# Altium project EMGintegrated.PrjPcb
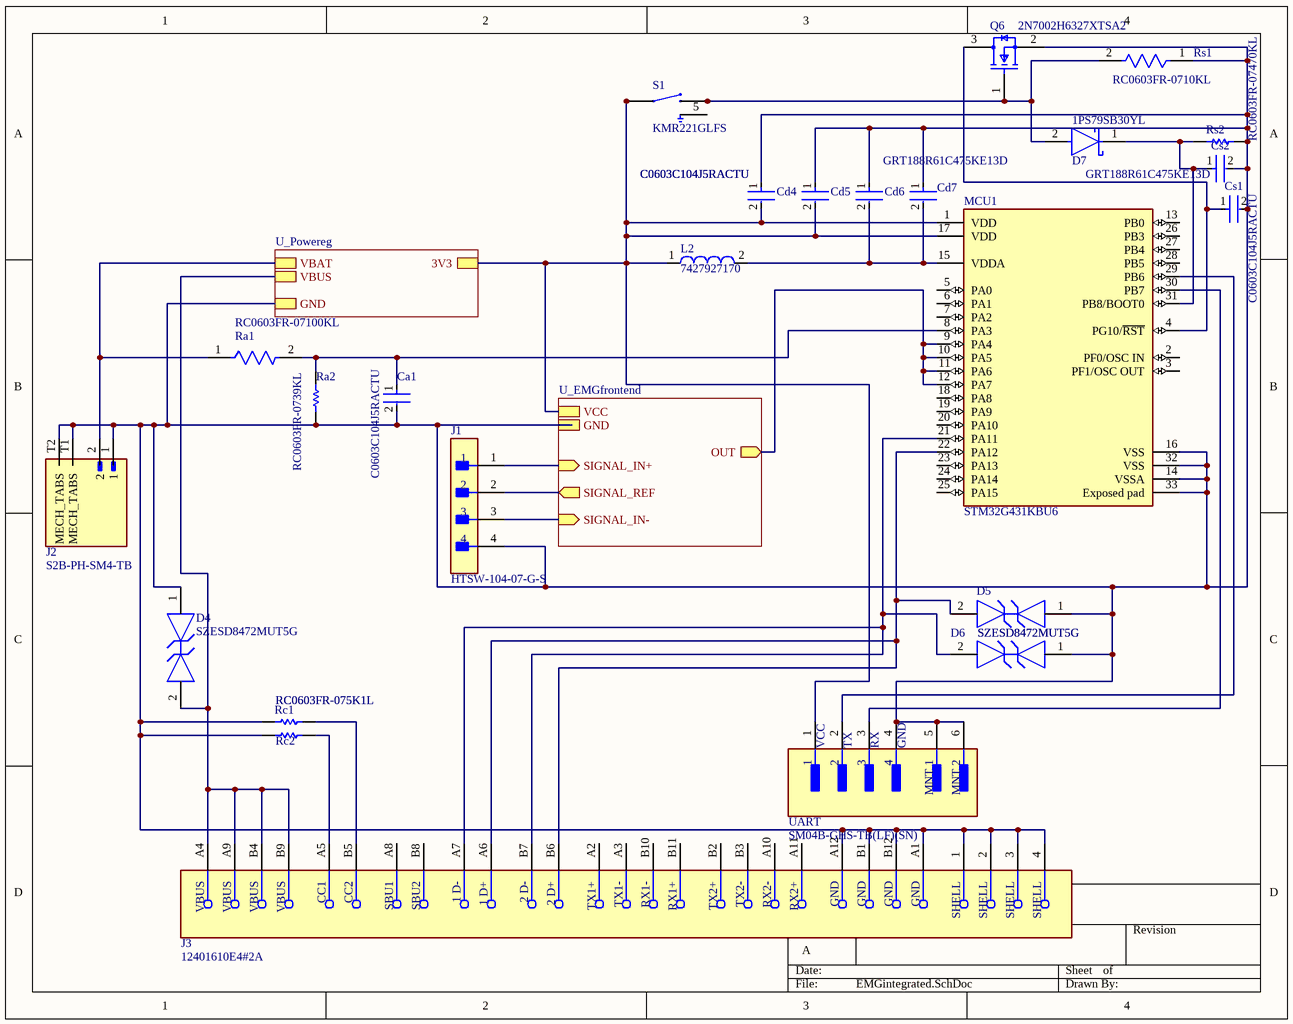
[diagram p0: EMGintegrated.SchDoc]
8 sheets, 62 parts. Net scope: hierarchical (ports join the sheet entries above them; power ports are global).
Board file: EMGintegrated.PcbDoc
Sheets:
  EMGintegrated.SchDoc
    U_EMGfrontend = EMGfrontend.SchDoc
      VREF = VREF.SchDoc
      AMP2 = AMP2.SchDoc
      LPF(500Hz) = LPF(500Hz).SchDoc
      AMP1 = AMP1.SchDoc
      HPF(20Hz) = HPF(20Hz).SchDoc
    U_Powereg = Powereg.SchDoc

## Sheet EMGintegrated.SchDoc
size A; SheetNumber: 1; SheetTotal: 8

### Parts
Ca1  C0603C104J5RACTU  [FP-C0603C-CF-MFG]
Cd4  C0603C104J5RACTU  [FP-C0603C-CF-MFG]
Cd5  C0603C104J5RACTU  [FP-C0603C-CF-MFG]
Cd6  C0603C104J5RACTU  [FP-C0603C-CF-MFG]
Cd7  GRT188R61C475KE13D  [FP-GRT188-0_15-IPC_C]
Cs1  C0603C104J5RACTU  [FP-C0603C-CF-MFG]
Cs2  GRT188R61C475KE13D  [FP-GRT188-0_15-IPC_C]
D4  SZESD8472MUT5G  [FP-152AF-MFG]
D5  SZESD8472MUT5G  [FP-152AF-MFG]
D6  SZESD8472MUT5G  [FP-152AF-MFG]
D7  1PS79SB30YL  [FP-SOD523-MFG]
J1  HTSW-104-07-G-S  [FP-HTSW-104-07-G-S-MFG]
J2  S2B-PH-SM4-TB  [JST_S2B-PH-SM4-TB]
J3  12401610E4#2A  [FP-12401610E4#2A-MFG]
L2  7427927170  [SMD-0402]
MCU1  STM32G431KBU6  [FP-UFQFPN32-A0B8-IPC_A]
Q6  2N7002H6327XTSA2  [FP-PG-SOT23-3-MFG]
Ra1  RC0603FR-07100KL  [FP-RC0603-0_55-MFG]
Ra2  RC0603FR-0739KL  [RESC1608X55X25LL10T15]
Rc1  RC0603FR-075K1L  [RESC1608X55X25ML10T15]
Rc2  RC0603FR-075K1L  [RESC1608X55X25ML10T15]
Rs1  RC0603FR-0710KL  [FP-RC0603-0_55-IPC_C]
Rs2  RC0603FR-07470KL  [RESC1608X55X25ML10T15]
S1  KMR221GLFS  [SW_KMR221GLFS]
UART  SM04B-GHS-TB(LF)(SN)  [FP-SM04B-GHS-TB_LF_SN-MFG]

### Sub-sheets
U_EMGfrontend = EMGfrontend.SchDoc: OUT (out), VCC, GND, SIGNAL_IN+ (in), SIGNAL_REF (out), SIGNAL_IN- (in)
U_Powereg = Powereg.SchDoc: VBAT, 3V3, GND, VBUS

### Nets
NetC0_1: MCU1.9(PA4) MCU1.10(PA5) MCU1.11(PA6) MCU1.12(PA7) ; sheet U_EMGfrontend/OUT
NetC0_2: Ca1.2 Cd4.1 Cd5.1 Cd6.1 Cd7.1 Cs1.2 Cs2.2 D4.1 D5.1 D6.1 J1.4 J2.1 J2.T1(MECH_TABS) J2.T2(MECH_TABS) J3.1(SHELL) J3.2(SHELL) J3.3(SHELL) J3.4(SHELL) J3.A1(GND) J3.A12(GND) J3.B1(GND) J3.B12(GND) MCU1.14(VSSA) MCU1.16(VSS) MCU1.32(VSS) MCU1.33(Exposed_pad) Q6.2(source) Ra2.1 Rc1.1 Rc2.1 Rs1.1 Rs2.2 UART.4 UART.5(MNT_1) UART.6(MNT_2) ; sheet U_EMGfrontend/GND, sheet U_Powereg/GND
NetC1_1: J1.2 ; sheet U_EMGfrontend/SIGNAL_REF
NetCa1_1: Ca1.1 MCU1.8(PA3) Ra1.2 Ra2.2
NetCd4_2: Cd4.2 Cd5.2 L2.1 MCU1.1(VDD) MCU1.17(VDD) S1.1 S1.4 UART.1 ; sheet U_EMGfrontend/VCC, sheet U_Powereg/3V3
NetCd6_2: Cd6.2 Cd7.2 L2.2 MCU1.15(VDDA)
NetCs1_1: Cs1.1 MCU1.4(PG10/~{RST}) Q6.3(drain)
NetCs2_1: Cs2.1 D7.1(C) MCU1.31(PB8/BOOT0) Rs2.1
NetD2_2: J2.2 Ra1.1 ; sheet U_Powereg/VBAT
NetD3_2: D4.2 J3.A4(VBUS) J3.A9(VBUS) J3.B4(VBUS) J3.B9(VBUS) ; sheet U_Powereg/VBUS
NetD5_2: D5.2 J3.A6(1_D+) J3.B6(2_D+) MCU1.22(PA12)
NetD6_2: D6.2 J3.A7(1_D-) J3.B7(2_D-) MCU1.21(PA11)
NetD7_2: D7.2(A) Q6.1(gate) Rs1.2 S1.2 S1.3
NetJ1_1: J1.1 ; sheet U_EMGfrontend/SIGNAL_IN+
NetJ1_3: J1.3 ; sheet U_EMGfrontend/SIGNAL_IN-
NetJ3_A5: J3.A5(CC1) Rc2.2
NetJ3_B5: J3.B5(CC2) Rc1.2
NetMCU1_29: MCU1.29(PB6) UART.2
NetMCU1_30: MCU1.30(PB7) UART.3

Not connected (* = marked no-connect by the designer): J3 A2(TX1+) A3(TX1-) A8(SBU1) A10(RX2-) A11(RX2+) B2(TX2+) B3(TX2-) B8(SBU2) B10(RX1-) B11(RX1+); MCU1 2(PF0/OSC_IN) 3(PF1/OSC_OUT) 5(PA0) 6(PA1) 7(PA2) 13(PB0) 18(PA8) 19(PA9) 20(PA10) 23(PA13) 24(PA14) 25(PA15) 26(PB3) 27(PB4) 28(PB5); S1 5

### Notes on the sheet
- (near UART) VCC
- (near UART) TX
- (near UART) RX
- (near UART) GND

### Library data of the parts
Ca1 Cd4-Cd6 Cs1 = CMP-2006-03056-2: CAP CER 0.1UF 50V 5% X7R 0603; Manufacturer: KEMET; Automotive Grade: Grade 1; Tolerance: 0.05; Capacitance: 0.10 μF; Value: 0.10 μF; Temperature Coefficient: 30ppm/°C; ComponentLink2Description: Datasheet; Voltage Rating: 50 V; Digikey Description: CAP CER 0.1UF 50V 5% X7R 0603; Manufacturer Part Number: C0603C104J5RACTU; Temperature Range High: +125°C; Device Class L2: Capacitors; Octopart: https://octopart.com/c0603c104j5ractu-kemet-10440638; RoHS: TRUE; Mouser Description: Multilayer Ceramic Capacitors MLCC - SMD/SMT 50volts 0.1uF X7R 5%; Temperature Range Low: -55°C; Automotive: Yes; Lead Free: Yes; ComponentLink2URL: https://api.kemet.com/component-edge/download/datasheet/C0603C100J5GACAUTO.pdf; Material: Ceramic; Device Class L3: Ceramic Capacitors; Package: C0603C-CF; Category: Cap; Temperature: -55°C to +125°C; Height: 0.87mm; Temperature Characteristic: X7R; Device Class L1: Passive Components
Cd7 Cs2 = CMP-06035-009119-1: Multi-Layer Ceramic Capacitor 4.7uF 16V X5R ±10% 0603 Paper T/R; Mount: Surface Mount; Width: 0.031inch; Case Code (Imperial): 0603; Capacitance: 4.7uF; Thickness: 0.035inch; Packaging: Cut Tape; Min Operating Temperature: -55°C; Case Code (Metric): 1608; Case/Package: 0603; Tolerance: 10%; Length: 0.063inch; Ratings: AEC-Q200; Max Operating Temperature: 85°C; Voltage Rating: 16V
D4-D6 = CMP-07200-000010-1: TVS DIODE 5.3V 14V 2X3DFN; Number of Bidirectional Channels: 1; Element Configuration: Single; Capacitance: 0.3pF; Peak Pulse Current: 3A; Power Line Protection: No; Min Breakdown Voltage: 7V; Direction: Bidirectional; Case/Package: DFN; Lead Free: Lead Free; Reverse Standoff Voltage: 5.3V; Clamping Voltage: 14V; Resistor Type: Zener; Packaging: Tape and Reel; Mount: Surface Mount; Number of Pins: 2; Max Operating Temperature: 150°C; Min Operating Temperature: -55°C; Working Voltage: 5.3V; RoHS Compliant: Yes
D7 = CMP-14398-000044-1: Schottky Diode, Single, 150Deg C, Sod523 Rohs Compliant: Yes
J1 = CMP-02766-001776-1: CONN HEADER VERT 4POS 2.54MM; Gender: Male; Number of Contacts: 4; Packaging: Bulk; RoHS Compliant: Yes; Number of Rows: 1; Mount: Through Hole; Contact Material: Bronze; Series: HTSW; Radiation Hardening: No; Pitch: 2.54mm; Reach SVHC Compliant: Yes; Contact Plating: Gold; Termination: Through Hole
J2 = S2B-PH-SM4-TB: MANUFACTURER: JST Sales; UNIT: MM; MAXIMUM_PACKAGE_HEIGHT: 5.5mm; MPN: S2B-PH-SM4-TB; STANDARD: Manufacturer Recommendations; Value: *
J3 = CMP-02355-000003-1: CONN RCP USB3.1 TYPEC 24P SMD RA; Connector Type: USB; Number of Contacts: 24; Gender: Receptacle; Packaging: Cut Tape; Mount: Surface Mount; Number of Pins: 24
L2 = CMP-0220-00142-1: SMD EMI Suppression Ferrite Bead WE-CBF, Z = 75 Ohm; Impedance: 75 Ohm; ComponentLink2Description: Datasheet; ComponentLink2URL: http://www.we-online.de/katalog/media/pdf/7427927170.pdf; ComponentLink1URL: http://www.we-online.com; PackageVersion: 2009; ComponentLink1Description: Manufacturer Link; PackageReference: SMD-0402; PackageDescription: Chip Inductor, 2-Leads, Body 1.0 x 0.5 mm; DatasheetVersion: ver 1, Jul-2009
MCU1 = CMP-12105-000119-1: IC MCU 32BIT 128KB FLSH 32UFQFPN; RoHS Compliant: Yes
Q6 = CMP-32901-000180-1: MOSFET N-CH 60V 0.3A SOT23; Rise Time: 3.3ns; Input Capacitance: 20pF; Rds On Max: 3R; Gate to Source Voltage (Vgs): 20V; Continuous Drain Current (ID): 300mA; Max Power Dissipation: 500mW; Packaging: Tape and Reel; Mount: Surface Mount; Case/Package: SOT-23; Drain to Source Voltage (Vdss): 60V; Min Operating Temperature: -55°C; Halogen Free: Halogen Free; Max Dual Supply Voltage: 60V; Number of Pins: 3; Lead Free: Lead Free; Max Operating Temperature: 150°C
Ra1 = CMP-2100-03662-2: RES SMD 100K OHM 1% 1/10W 0603; Voltage Rating (DC): 50V; Resistance: 100kR; Max Power Dissipation: 100mW; Temperature Coefficient: 100ppm/°C; Working Voltage: 75V; Length: 1.6mm; Lead Free: Lead Free; Number of Terminations: 2; Packaging: Tape and Reel; Voltage Rating: 50V; Termination: SMD/SMT; Width: 0.8mm; Resistor Type: Thick Film; Resistance Tolerance: 1%; Features: Moisture Resistant; Height: 0.45mm; Construction: Rectangular; Case/Package: 0603; Military Standard: Not; Case Code (Imperial): 0603; Series: RC; Technology: THICK FILM; Depth: 0.8mm; RoHS Compliant: Yes; REACH SVHC: No SVHC; Min Operating Temperature: -55°C; Case Code (Metric): 1608; Max Operating Temperature: 155°C; Power Rating: 100mW; Number of Pins: 2; Tolerance: 1%
Ra2 = CMP-2000-06940-1: Chip Resistor, 39 KOhm, +/- 1%, 0.1 W, -55 to 155 degC, 0603 (1608 Metric), RoHS, Tape and Reel; Manufacturer: Yageo; Resistance: 39kOhms; Voltage Rating: 50V; Power Rating: 100mW; Temperature Coefficient: 100PPM/C; Product: ThickFilmResistorsGeneralPurpose; Case Code - in: 0603; Tolerance: 1%; Operating Temperature Range: -55Cto+155C; Series: RC; Package Description: 2-Pin Surface Mount Device, Body 1.6 x 0.8 mm; Datasheet URL: http://www.yageo.com/documents/recent/PYu-RC_Group_51_RoHS_L_7.pdf; Package Reference: 0603; Case Code - mm: 1608; Datasheet Version: Rev. 7, 05/2017; Mounting Technology: SurfaceMount; Packaging: Reel; Manufacturer URL: http://www.yageo.com/; Termination Style: SMD/SMT
Rc1 Rc2 = CMP-2000-04091-1: Manufacturer: Yageo; Part Number: RC0603FR-075K1L
Rs1 = CMP-2100-03664-2: RES 10K OHM 1% 1/10W 0603; Voltage Rating: 75V; Voltage Rating (DC): 50V; Resistance: 10kR; Power Rating: 100mW; Temperature Coefficient: 100ppm/°C; Depth: 0.8mm; Termination: SMD/SMT; Resistor Type: Thick Film; Series: RC; Construction: Rectangular; Features: Moisture Resistant; Packaging: Tape and Reel; Min Operating Temperature: -55°C; Number of Terminations: 2; Lead Pitch: 0.3mm; RoHS Compliant: Yes; Case/Package: 0603; Resistance Tolerance: 1%; Military Standard: Not; Weight: 7.1E-05oz; Number of Pins: 2; Tolerance: 1%; Length: 1.6mm; Case Code (Imperial): 0603; Lead Free: Lead Free; Width: 0.8mm; Max Power Dissipation: 100mW; Height: 0.45mm; Max Operating Temperature: 155°C; Case Code (Metric): 1608; Size Code: 0603
Rs2 = CMP-1659-00049-1: Chip Resistor, 470 KOhm, +/- 1%, 0.1 W, -55 to 155 degC, 0603 (1608 Metric), RoHS, Tape and Reel; ComponentLink1Description: Manufacturer URL; ComponentLink2Description: Datasheet; ComponentLink2URL: http://www.yageo.com/documents/recent/PYu-RC_Group_51_RoHS_L_04.pdf; PackageReference: 0603; DatasheetVersion: Rev. 4, 02/2016; ComponentLink1URL: http://www.yageo.com/; PackageDescription: 2-Pin Surface Mount Device, Body 1.6 x 0.8 mm
S1 = KMR221GLFS: Switch Tactile N.O. SPST Button Gull Wing 0.05A 32VDC 1VA 200000Cycles 2N SMD Automotive T/R; MF: CK; SnapEDA_Link: https://www.snapeda.com/parts/KMR221G%20LFS/C%2526K/view-part/?ref=snap; Package: None; Value: *; MP: KMR221G LFS; Check_prices: https://www.snapeda.com/parts/KMR221G%20LFS/C%2526K/view-part/?ref=eda
UART = CMP-17439-000411-1: CONN HEADER SMD R/A 4POS 1.25MM; Voltage Rating: 50V; Number of Contacts: 4; Current Rating: 1A; Termination: Solder; Mount: Surface Mount; REACH SVHC: No SVHC; Packaging: Cut Tape; Contact Material: Bronze; Series: GH; Orientation: Right Angle; Lead Free: Lead Free; Housing Material: Nylon; Contact Plating: Tin; Housing Color: Natural; Number of Rows: 1; Pitch: 1.25mm; Number of Positions: 4

## Sheet EMGfrontend.SchDoc
size A; SheetNumber: 2; SheetTotal: 8
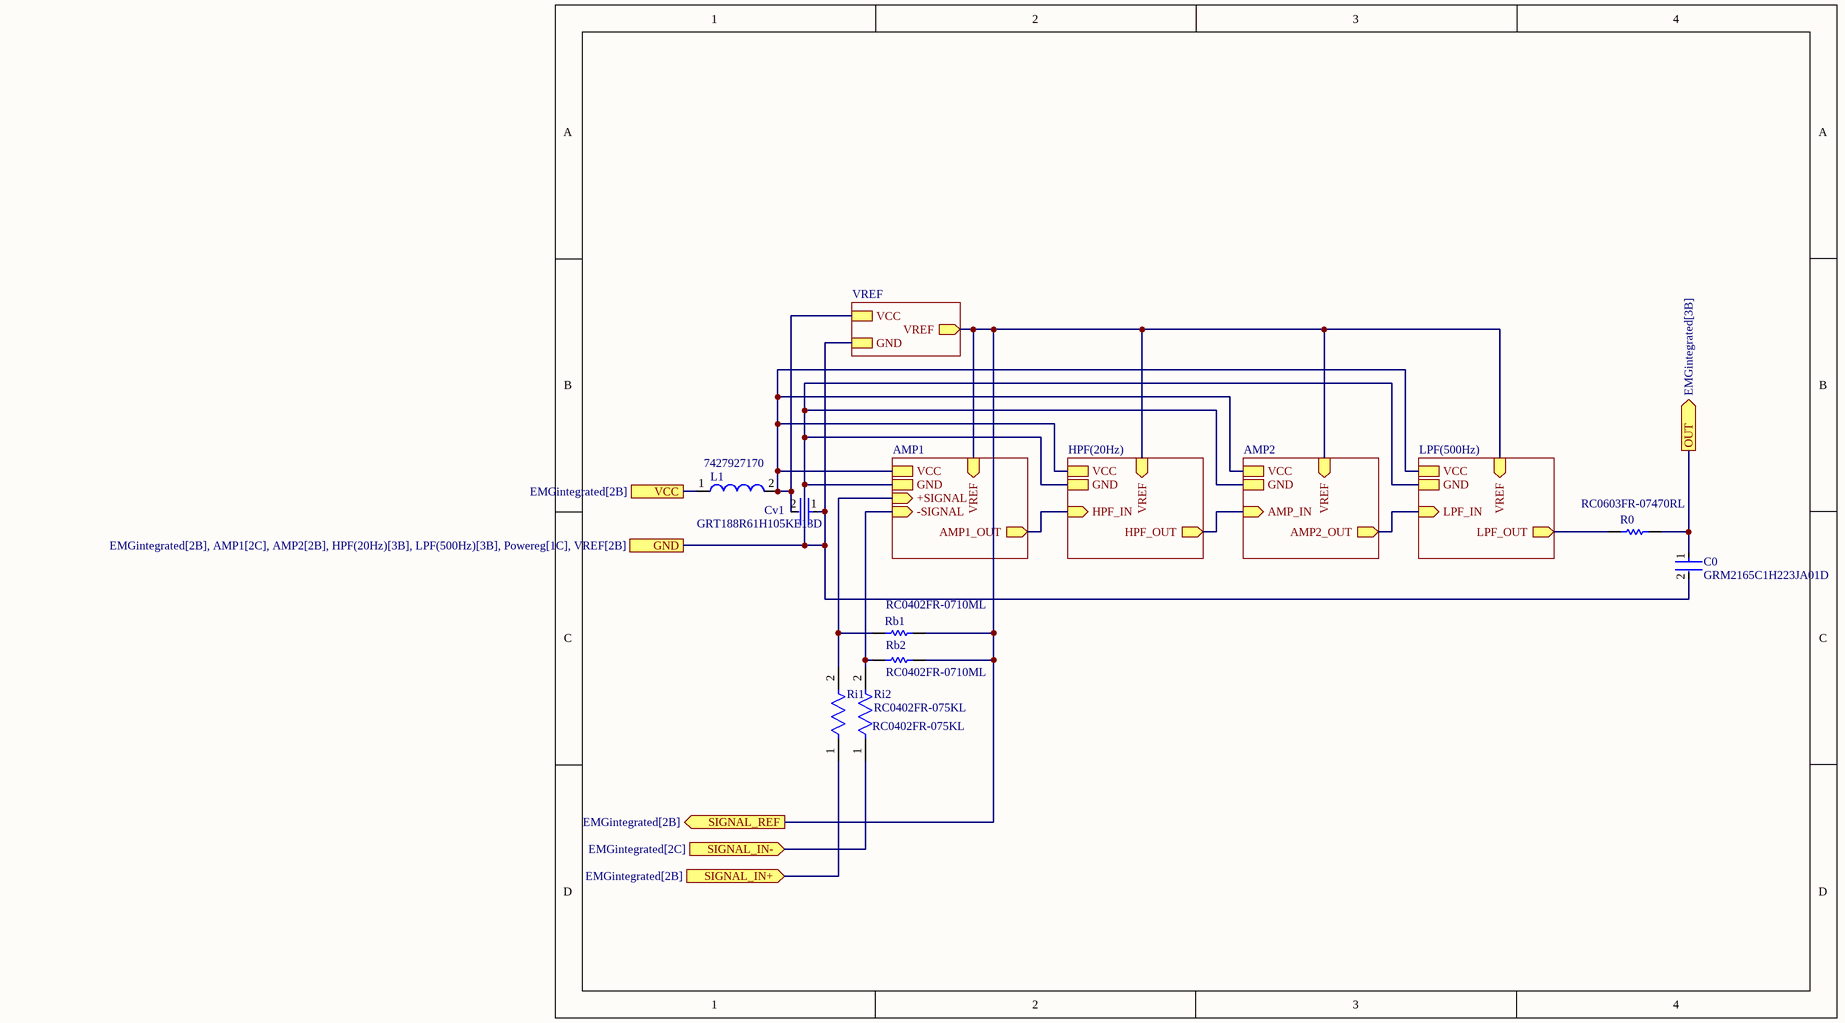
[diagram p1: EMGfrontend.SchDoc]

### Parts
C0  GRM2165C1H223JA01D  [FP-GRM216-0_1-0_05-D]
Cv1  GRT188R61H105KE13D  [FP-GRT188-0_1-e0_2_0_5-IPC_B]
L1  7427927170  [SMD-0402]
R0  RC0603FR-07470RL  [RESC1608X55X25LL10T15]
Rb1  RC0402FR-0710ML  [RESC1005X40X25MML05T10]
Rb2  RC0402FR-0710ML  [RESC1005X40X25MML05T10]
Ri1  RC0402FR-075KL  [FP-RC0402-MFG-TINY]
Ri2  RC0402FR-075KL  [FP-RC0402-MFG-TINY]

### Sub-sheets
AMP1 = AMP1.SchDoc: VREF (in), +SIGNAL (in), AMP1_OUT (out), GND, VCC, -SIGNAL (in)
AMP2 = AMP2.SchDoc: VREF (in), AMP_IN (in), VCC, GND, AMP2_OUT (out)
HPF(20Hz) = HPF(20Hz).SchDoc: HPF_IN (in), VREF (in), HPF_OUT (out), VCC, GND
LPF(500Hz) = LPF(500Hz).SchDoc: LPF_IN (in), VCC, GND, VREF (in), LPF_OUT (out)
VREF = VREF.SchDoc: VREF (out), VCC, GND

### Ports
GND (see EMGintegrated[2B], AMP1[2C], AMP2[2B], HPF(20Hz)[3B], LPF(500Hz)[3B], Powereg[1C], VREF[2B]), OUT (out, see EMGintegrated[3B]), SIGNAL_IN+ (in, see EMGintegrated[2B]), SIGNAL_IN- (in, see EMGintegrated[2C]), SIGNAL_REF (out, see EMGintegrated[2B]), VCC (see EMGintegrated[2B])

### Nets
NetC0_1: C0.1 R0.2 ; port OUT
NetC0_2: C0.2 Cv1.1 ; port GND, sheet VREF/GND, sheet AMP2/GND, sheet LPF(500Hz)/GND, sheet AMP1/GND, sheet HPF(20Hz)/GND
NetC1_1: Rb1.2 Rb2.2 ; port SIGNAL_REF, sheet VREF/VREF, sheet AMP2/VREF, sheet LPF(500Hz)/VREF, sheet AMP1/VREF, sheet HPF(20Hz)/VREF
NetC3_1: sheet AMP1/AMP1_OUT, sheet HPF(20Hz)/HPF_IN
NetC4_2: R0.1 ; sheet LPF(500Hz)/LPF_OUT
NetCd1_1: Cv1.2 L1.2 ; sheet VREF/VCC, sheet AMP2/VCC, sheet LPF(500Hz)/VCC, sheet AMP1/VCC, sheet HPF(20Hz)/VCC
NetCd4_2: L1.1 ; port VCC
NetJ1_1: Ri1.1 ; port SIGNAL_IN+
NetJ1_3: Ri2.1 ; port SIGNAL_IN-
NetR5_2: sheet AMP2/AMP_IN, sheet HPF(20Hz)/HPF_OUT
NetR7_2: sheet AMP2/AMP2_OUT, sheet LPF(500Hz)/LPF_IN
NetRb1_1: Rb1.1 Ri1.2 ; sheet AMP1/+SIGNAL
NetRb2_1: Rb2.1 Ri2.2 ; sheet AMP1/-SIGNAL

### Library data of the parts
C0 = CMP-06035-050815-1: Chip Multilayer Ceramic Capacitors for General Purpose, 0805, 22000pF, C0G, 30ppm/°C, 5%, 50V
Cv1 = CMP-06035-031856-1: Multi-Layer Ceramic Capacitor 1uF 50V X5R ±10% 0603 Paper T/R; Voltage Rating (DC): 50V; Voltage Rating: 50V; Min Operating Temperature: -55°C; Case Code (Metric): 1608; Thickness: 0.035inch; Width: 0.031inch; Capacitance: 1uF; Tolerance: 10%; Max Operating Temperature: 85°C; Dielectric: X5R; Case Code (Imperial): 0603; Case/Package: 0603; Length: 0.063inch; Packaging: Tape and Reel; Mount: Surface Mount; Ratings: AEC-Q200
L1 = CMP-0220-00142-1: as L2 on sheet EMGintegrated; ComponentLink2Description: Datasheet; ComponentLink2URL: http://www.we-online.de/katalog/media/pdf/7427927170.pdf; ComponentLink1URL: http://www.we-online.com; PackageVersion: 2009; ComponentLink1Description: Manufacturer Link; PackageReference: SMD-0402; PackageDescription: Chip Inductor, 2-Leads, Body 1.0 x 0.5 mm; DatasheetVersion: ver 1, Jul-2009
R0 = CMP-1659-00035-2: General Purpose Chip Resistor, 470 Ohm, +/- 1%, -55 to 155 degC, 0603 (1608 Metric), RoHS, Tape and Reel; Resistance: 470 Ohm; ComponentLink1Description: Manufacturer URL; Contact Plating: Gold; Width: 3.1 mm; Radiation Hardening: No; DatasheetVersion: Rev. 4, 04/2009; Length: 3 mm; PackageDescription: 2-Pin Surface Mount Device, Body 1.6 x 0.8 mm; ComponentLink1URL: http://www.yageo.com/; Min Operating Temperature: -40 degC; Mount: Surface Mount; Package Quantity: 2500; ComponentLink2URL: https://datasheet.ciiva.com/11808/0900766b80f96399-11808177.pdf; RoHSCompliant: true; Fastening Type: Snap; PackageReference: 0603; Max Operating Temperature: 90 degC; Height: 1.25 mm; Packaging: Tape and Reel; ComponentLink2Description: Datasheet; Contact Material: Brass
Rb1 Rb2 = CMP-2002-07354-1: Manufacturer: Yageo / Phycomp; Part Number: RC0402FR-0710ML
Ri1 Ri2 = CMP-03412-013078-1: RES SMD 5K OHM 1% 1/16W 0402; Manufacturer: Yageo; Resistance: 5kΩ; Temperature Coefficient: 100ppm/°C; Power Rating: 0.0625W; Voltage Rating: 50V; Value: 5kΩ; Temperature Range Low: -55°C; Lead Free: Yes; RoHS: TRUE; Device Class L2: Resistors; Package: RC0402; Footprint Url: https://pccomponents.com/datasheets/YAGEO-20RESISTORS.PDF; Height: 0.4mm; ComponentLink2URL: http://www.yageo.com/documents/recent/PYu-RC_Group_51_RoHS_L_10.pdf; Temperature: -55°C to +155°C; Composition: Thick Film; Device Class L1: Passive Components; Series: RC_L; Ipc Land Pattern Name: RESC10050X35; Tolerance: 1%; Device Class L3: Chip SMD Resistors; Temperature Range High: +155°C; Category: Res; Automotive: No; Octopart: https://octopart.com/rc0402fr-075kl-yageo-25450038; Digikey Description: RES SMD 5K OHM 1% 1/16W 0402; ComponentLink2Description: Datasheet; Manufacturer Part Number: RC0402FR-075KL

## Sheet VREF.SchDoc
size A; SheetNumber: 3; SheetTotal: 7
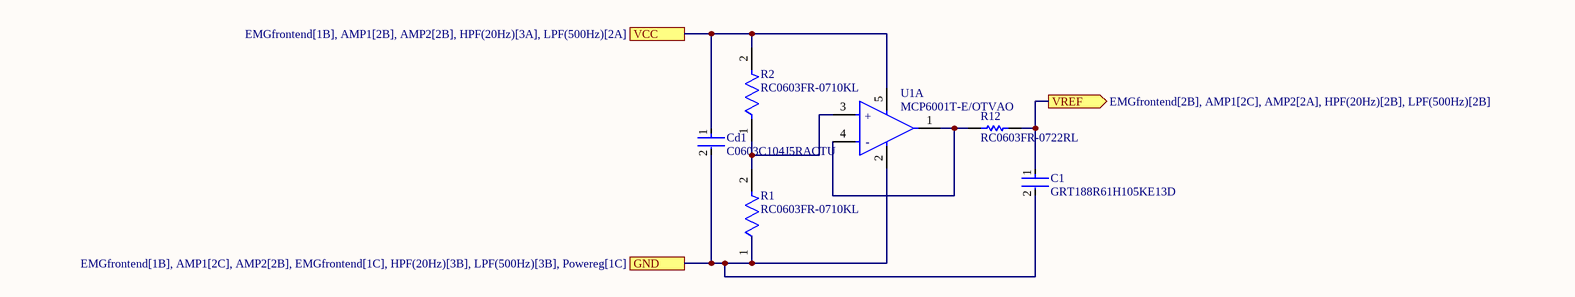
[diagram p2: VREF.SchDoc]

### Parts
C1  GRT188R61H105KE13D  [FP-GRT188-0_1-e0_2_0_5-IPC_B]
Cd1  C0603C104J5RACTU  [FP-C0603C-CF-MFG]
R1  RC0603FR-0710KL  [FP-RC0603-0_55-IPC_C]
R2  RC0603FR-0710KL  [FP-RC0603-0_55-IPC_C]
R12  RC0603FR-0722RL  [RESC1608X55X25NL10T15]
U1A  MCP6001T-E/OTVAO  [FP-C04-091-OT-MFG]

### Ports
GND (see EMGfrontend[1B], AMP1[2C], AMP2[2B], EMGfrontend[1C], HPF(20Hz)[3B], LPF(500Hz)[3B], Powereg[1C]), VCC (see EMGfrontend[1B], AMP1[2B], AMP2[2B], HPF(20Hz)[3A], LPF(500Hz)[2A]), VREF (out, see EMGfrontend[2B], AMP1[2C], AMP2[2A], HPF(20Hz)[2B], LPF(500Hz)[2B])

### Nets
NetC0_2: C1.2 Cd1.2 R1.1 U1A.2(VSS) ; port GND
NetC1_1: C1.1 R12.2 ; port VREF
NetCd1_1: Cd1.1 R2.2 U1A.5(VDD) ; port VCC
NetR1_2: R1.2 R2.1 U1A.3(VIN+)
NetR12_1: R12.1 U1A.1(VOUT) U1A.4(VIN-)

### Library data of the parts
C1 = CMP-06035-031856-1: as Cv1 on sheet EMGfrontend; Voltage Rating (DC): 50V; Voltage Rating: 50V; Min Operating Temperature: -55°C; Case Code (Metric): 1608; Thickness: 0.035inch; Width: 0.031inch; Capacitance: 1uF; Tolerance: 10%; Max Operating Temperature: 85°C; Dielectric: X5R; Case Code (Imperial): 0603; Case/Package: 0603; Length: 0.063inch; Packaging: Tape and Reel; Mount: Surface Mount; Ratings: AEC-Q200
Cd1 = CMP-2006-03056-2: as Ca1 on sheet EMGintegrated; ComponentLink2Description: Datasheet; Voltage Rating: 50 V; Digikey Description: CAP CER 0.1UF 50V 5% X7R 0603; Manufacturer Part Number: C0603C104J5RACTU; Temperature Range High: +125°C; Device Class L2: Capacitors; Octopart: https://octopart.com/c0603c104j5ractu-kemet-10440638; RoHS: TRUE; Mouser Description: Multilayer Ceramic Capacitors MLCC - SMD/SMT 50volts 0.1uF X7R 5%; Temperature Range Low: -55°C; Automotive: Yes; Lead Free: Yes; ComponentLink2URL: https://api.kemet.com/component-edge/download/datasheet/C0603C100J5GACAUTO.pdf; Material: Ceramic; Device Class L3: Ceramic Capacitors; Package: C0603C-CF; Category: Cap; Temperature: -55°C to +125°C; Height: 0.87mm; Temperature Characteristic: X7R; Device Class L1: Passive Components
R1 R2 = CMP-2100-03664-2: as Rs1 on sheet EMGintegrated; Depth: 0.8mm; Termination: SMD/SMT; Resistor Type: Thick Film; Series: RC; Construction: Rectangular; Features: Moisture Resistant; Packaging: Tape and Reel; Min Operating Temperature: -55°C; Number of Terminations: 2; Lead Pitch: 0.3mm; RoHS Compliant: Yes; Case/Package: 0603; Resistance Tolerance: 1%; Military Standard: Not; Weight: 7.1E-05oz; Number of Pins: 2; Tolerance: 1%; Length: 1.6mm; Case Code (Imperial): 0603; Lead Free: Lead Free; Width: 0.8mm; Max Power Dissipation: 100mW; Height: 0.45mm; Max Operating Temperature: 155°C; Case Code (Metric): 1608; Size Code: 0603
R12 = CMP-1659-00033-1: Chip Resistor, 22 Ohm, +/- 1%, 0.1 W, -55 to 155 degC, 0603 (1608 Metric), RoHS, Tape and Reel; Max Ouput Current: 8 A; Case\Package: SIP; Max Input Voltage: 1.4 V; ComponentLink2URL: http://www.yageo.com/documents/recent/PYu-RC_Group_51_RoHS_L_04.pdf; RoHSCompliant: true; Max Operating Temperature: 100 degC; PackageDescription: 2-Pin Surface Mount Device, Body 1.6 x 0.8 mm; ComponentLink1Description: Manufacturer URL; ComponentLink1URL: http://www.yageo.com/; Length: 18.5 mm; REACH SVHC: Unknown; Pins: 4; DatasheetVersion: Rev. 4, 02/2016; PackageReference: 0603; Output Current: 8 A; Min Operating Temperature: -25 degC; Height: 19.6 mm; Mount: Through Hole; Radiation Hardening: No; ComponentLink2Description: Datasheet; Package Quantity: 200; Packaging: Rail/Tube
U1A = CMP-06302-000184-2: None; NexarPartId: 52876797; Min Supply Voltage: 1.8V; Output Current per Channel: 23mA; Max Junction Temperature (Tj): 150°C; Input Bias Current: 1.1nA; Max Supply Voltage: 6V; Input Offset Voltage (Vos): 4.5mV; Voltage Gain: 112dB; Nominal Supply Current: 100µA; Number of Channels: 1; RoHS: Non-Compliant; Height: 1.45mm; Max Operating Temperature: 125°C; Ambient Temperature Range High: 125°C; Case/Package: SOT-23-5; Min Operating Temperature: -40°C; Lifecycle Status: Production

## Sheet AMP2.SchDoc
size A; SheetNumber: 7; SheetTotal: 8
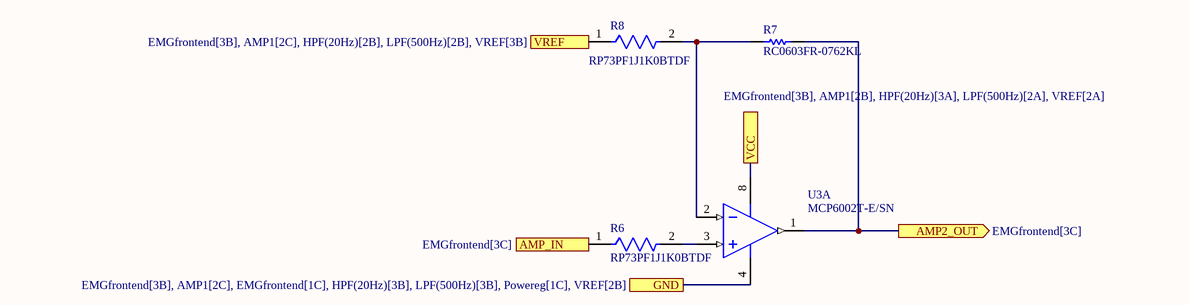
[diagram p3: AMP2.SchDoc]

### Parts
R6  RP73PF1J1K0BTDF  [FP-RP73P-1J-MFG]
R7  RC0603FR-0762KL  [RESC1608X55X25NL10T15]
R8  RP73PF1J1K0BTDF  [FP-RP73P-1J-MFG]
U3  MCP6002T-E/SN  [SOIC-SN8_N]  (part A of 2)

### Ports
AMP2_OUT (out, see EMGfrontend[3C]), AMP_IN (in, see EMGfrontend[3C]), GND (see EMGfrontend[3B], AMP1[2C], EMGfrontend[1C], HPF(20Hz)[3B], LPF(500Hz)[3B], Powereg[1C], VREF[2B]), VCC (see EMGfrontend[3B], AMP1[2B], HPF(20Hz)[3A], LPF(500Hz)[2A], VREF[2A]), VREF (in, see EMGfrontend[3B], AMP1[2C], HPF(20Hz)[2B], LPF(500Hz)[2B], VREF[3B])

### Nets
NetC0_2: U3.4(VSS) ; port GND
NetC1_1: R8.1 ; port VREF
NetCd1_1: U3.8(VDD) ; port VCC
NetR5_2: R6.1 ; port AMP_IN
NetR6_2: R6.2 U3.3(VINA+)
NetR7_1: R7.1 R8.2 U3.2(VINA-)
NetR7_2: R7.2 U3.1(VOUTA) ; port AMP2_OUT

### Library data of the parts
R6 R8 = CMP-03211-004517-1: RES SMD 1K OHM 0.1% 1/6W 0603; Manufacturer: TE Connectivity; Value: 1KΩ; Power Rating: 0.166W; Tolerance: 0.001; Temperature Coefficient: 25ppm/°C; Voltage Rating: 100V; Composition: Thin Film; Category: Res; Temperature Range High: +155°C; Device Class L1: Passive Components; Digikey Description: RES SMD 1K OHM 0.1% 1/6W 0603; Lead Free: Yes; RoHS: TRUE; Ipc Land Pattern Name: RESC15580X45; Automotive: No; Temperature: -55°C to +155°C; Height: 0.55mm; ComponentLink2URL: https://www.te.com/commerce/DocumentDelivery/DDEController?Action=srchrtrv&DocNm=1773272&DocType=DS&DocLang=English; Manufacturer Part Number: RP73PF1J1K0BTDF; Resistance: 1KΩ; ComponentLink2Description: Datasheet; Temperature Range Low: -55°C; Octopart: https://octopart.com/rp73pf1j1k0btdf-te+connectivity-45465729; Device Class L3: Chip SMD Resistors; Series: RP73P; Package: RP73P-1J; Device Class L2: Resistors
R7 = CMP-2000-04104-1: Manufacturer: Yageo; Part Number: RC0603FR-0762KL
U3 = CMP-0187-00363-3: None; Nominal Supply Current: 100uA; Operating Supply Voltage: 5.5V; Input Bias Current: 1pA; Output Current per Channel: 23mA; Unity Gain Bandwidth Product: 1MHz; Number of Elements: 2; Power Supply Rejection Ratio (PSRR): 86dB; Slew Rate: 0.6V/µs; Min Supply Voltage: 1.8V; Voltage Gain: 112dB; Max Supply Voltage: 6V; Input Offset Voltage (Vos): 4.5mV; Common Mode Rejection Ratio: 60dB; Amplifier Type: GENERAL PURPOSE; Technology: CMOS; Output Current: 23mA; Number of Pins: 8; Lead Free: Lead Free; Number of Channels: 2; Package Quantity: 3300; Max Operating Temperature: 125°C; Number of Circuits: 2; Supply Current: 100uA; Gain Bandwidth Product: 1MHz; Min Operating Temperature: -40°C; Series: -; Mount: Surface Mount; Case/Package: SOIC; Radiation Hardening: No; Packaging: Tape and Reel; Operating Supply Current: 100uA; RoHS Compliant: Yes

## Sheet LPF(500Hz).SchDoc
size A; SheetNumber: 4; SheetTotal: 8
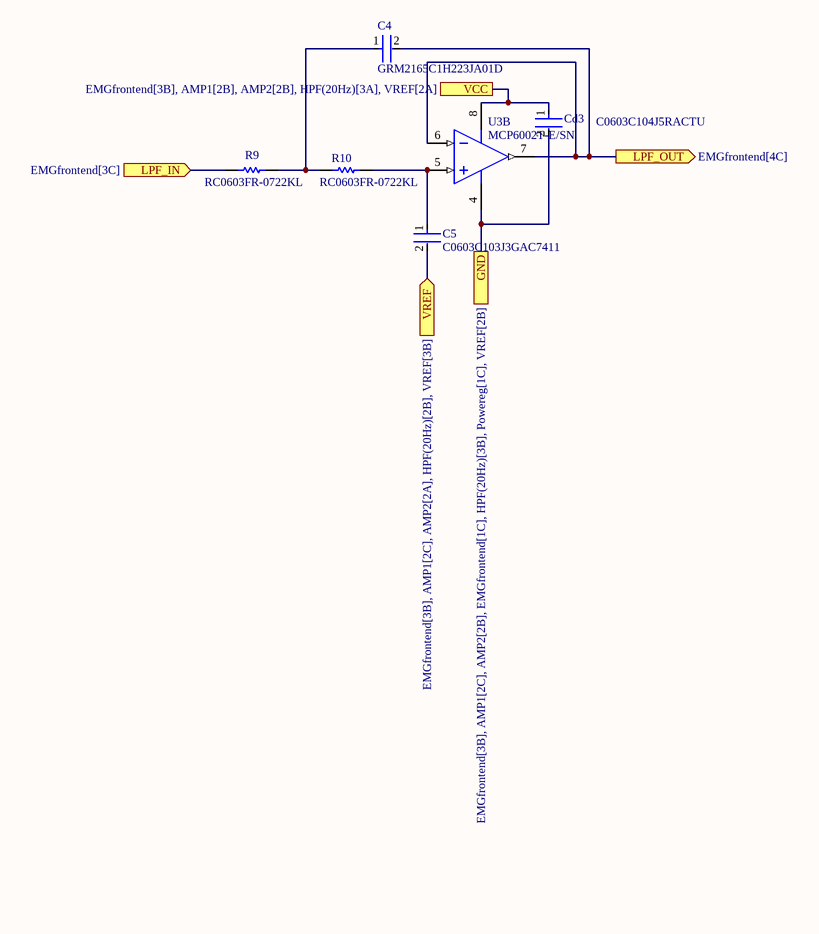
[diagram p4: LPF(500Hz).SchDoc]

### Parts
C4  GRM2165C1H223JA01D  [FP-GRM216-0_1-0_05-D]
C5  C0603C103J3GAC7411  [FP-C0603C-CF-MFG]
Cd3  C0603C104J5RACTU  [FP-C0603C-CF-MFG]
R9  RC0603FR-0722KL  [RESC1608X55X25ML10T15]
R10  RC0603FR-0722KL  [RESC1608X55X25ML10T15]
U3  MCP6002T-E/SN  [SOIC-SN8_N]  (part B of 2)

### Ports
GND (see EMGfrontend[3B], AMP1[2C], AMP2[2B], EMGfrontend[1C], HPF(20Hz)[3B], Powereg[1C], VREF[2B]), LPF_IN (in, see EMGfrontend[3C]), LPF_OUT (out, see EMGfrontend[4C]), VCC (see EMGfrontend[3B], AMP1[2B], AMP2[2B], HPF(20Hz)[3A], VREF[2A]), VREF (in, see EMGfrontend[3B], AMP1[2C], AMP2[2A], HPF(20Hz)[2B], VREF[3B])

### Nets
NetC0_2: Cd3.2 U3.4(VSS) ; port GND
NetC1_1: C5.2 ; port VREF
NetC4_1: C4.1 R9.2 R10.1
NetC4_2: C4.2 U3.6(VINB-) U3.7(VOUTB) ; port LPF_OUT
NetC5_1: C5.1 R10.2 U3.5(VINB+)
NetCd1_1: Cd3.1 U3.8(VDD) ; port VCC
NetR7_2: R9.1 ; port LPF_IN

### Library data of the parts
C4 = CMP-06035-050815-1: as C0 on sheet EMGfrontend
C5 = CMP-03020-031050-2: C0603 10,000 pF C0G 30ppm/°C 5.00% 25 V; Manufacturer: KEMET; Tolerance: 0.05; Material: Ceramic; Automotive Grade: Grade 1; Voltage Rating: 25 V; Device Class L3: Ceramic Capacitors; ComponentLink2URL: https://api.kemet.com/component-edge/download/datasheet/C0603C100J5GACAUTO.pdf; Capacitance: 10,000 pF; RoHS: TRUE; Manufacturer Part Number: C0603C103J3GAC7411; Temperature Coefficient: 30ppm/°C; Lead Free: Yes; Height: 0.87mm; Temperature Range Low: -55°C; Value: 10,000 pF; Temperature Range High: +125°C; ComponentLink2Description: Datasheet; Package: C0603C-CF; Temperature Characteristic: C0G; Temperature: -55°C to +125°C; Category: Cap; Octopart: https://octopart.com/c0603c103j3gac7411-kemet-91893810; Device Class L2: Capacitors; Device Class L1: Passive Components; Automotive: Yes
Cd3 = CMP-2006-03056-2: as Ca1 on sheet EMGintegrated; ComponentLink2Description: Datasheet; Voltage Rating: 50 V; Digikey Description: CAP CER 0.1UF 50V 5% X7R 0603; Manufacturer Part Number: C0603C104J5RACTU; Temperature Range High: +125°C; Device Class L2: Capacitors; Octopart: https://octopart.com/c0603c104j5ractu-kemet-10440638; RoHS: TRUE; Mouser Description: Multilayer Ceramic Capacitors MLCC - SMD/SMT 50volts 0.1uF X7R 5%; Temperature Range Low: -55°C; Automotive: Yes; Lead Free: Yes; ComponentLink2URL: https://api.kemet.com/component-edge/download/datasheet/C0603C100J5GACAUTO.pdf; Material: Ceramic; Device Class L3: Ceramic Capacitors; Package: C0603C-CF; Category: Cap; Temperature: -55°C to +125°C; Height: 0.87mm; Temperature Characteristic: X7R; Device Class L1: Passive Components
R9 R10 = CMP-1012-00659-3: Chip Resistor, 22 KOhm, +/- 1%, 0.1 W, -55 to 155 degC, 0603 (1608 Metric), RoHS, Tape and Reel; Tolerance: 10%; Current Rating: 290 mA; Shielding: Unshielded; Resistance: 2.9 Ohm; PackageReference: 0603; PackageDescription: 2-Pin Surface Mount Device, Body 1.6 x 0.8 mm; ComponentLink2URL: http://www.yageo.com/documents/recent/PYu-RC_Group_51_RoHS_L_04.pdf; RoHSCompliant: True; REACH SVHC: No SVHC; ComponentLink1Description: Manufacturer URL; ComponentLink2Description: Datasheet; DatasheetVersion: Rev. 4, 02/2016; Min Operating Temperature: -55degC; Pins: 2; Mount: Through Hole; Height: 11 mm; Packaging: Bulk; Radiation Hardening: No; Package Quantity: 100; Diameter: 8.5 mm; Lead Pitch: 5 mm; Case/Package: Radial; Max Operating Temperature: 105degC; ComponentLink1URL: http://www.yageo.com/
U3 = CMP-0187-00363-3: as U3 on sheet AMP2; Technology: CMOS; Output Current: 23mA; Number of Pins: 8; Lead Free: Lead Free; Number of Channels: 2; Package Quantity: 3300; Max Operating Temperature: 125°C; Number of Circuits: 2; Supply Current: 100uA; Gain Bandwidth Product: 1MHz; Min Operating Temperature: -40°C; Series: -; Mount: Surface Mount; Case/Package: SOIC; Radiation Hardening: No; Packaging: Tape and Reel; Operating Supply Current: 100uA; RoHS Compliant: Yes

## Sheet AMP1.SchDoc
size A; SheetNumber: 7; SheetTotal: 7
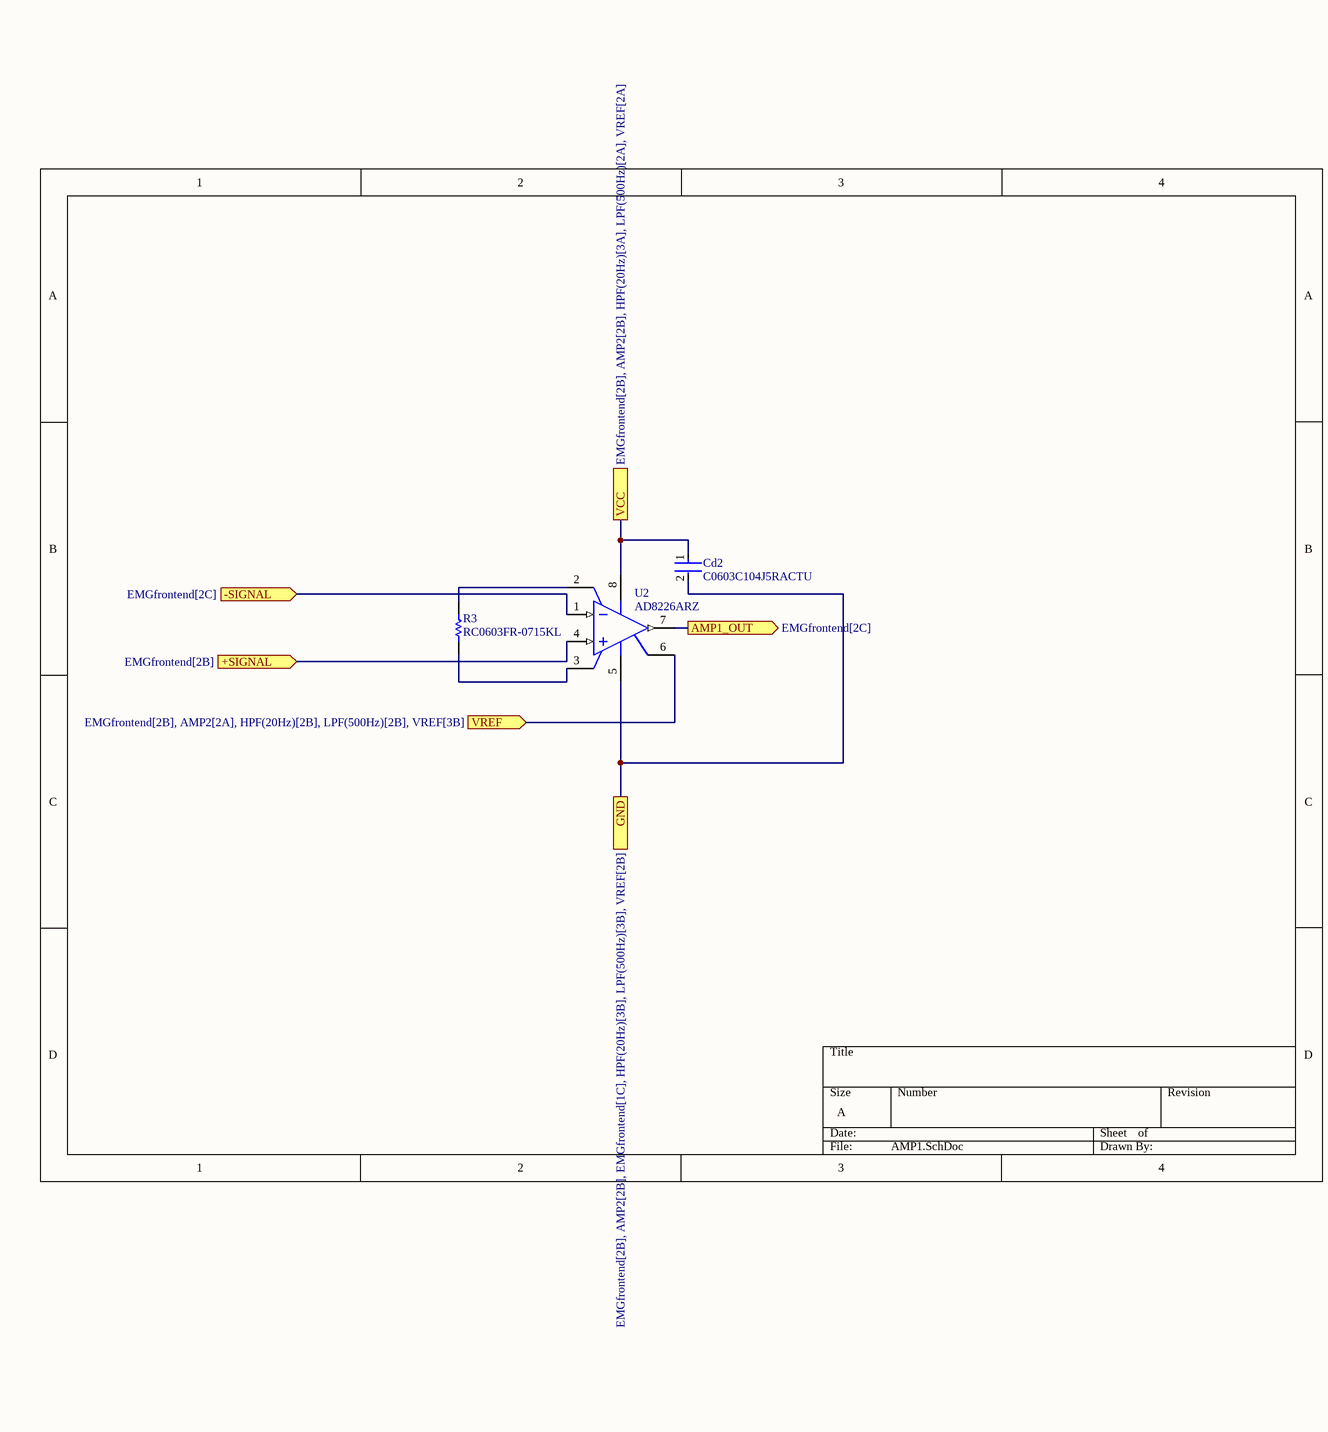
[diagram p5: AMP1.SchDoc]

### Parts
Cd2  C0603C104J5RACTU  [FP-C0603C-CF-MFG]
R3  RC0603FR-0715KL  [RESC1608X55X25LL10T15]
U2  AD8226ARZ  [ADI-R-8_L]

### Ports
+SIGNAL (in, see EMGfrontend[2B]), -SIGNAL (in, see EMGfrontend[2C]), AMP1_OUT (out, see EMGfrontend[2C]), GND (see EMGfrontend[2B], AMP2[2B], EMGfrontend[1C], HPF(20Hz)[3B], LPF(500Hz)[3B], VREF[2B]), VCC (see EMGfrontend[2B], AMP2[2B], HPF(20Hz)[3A], LPF(500Hz)[2A], VREF[2A]), VREF (in, see EMGfrontend[2B], AMP2[2A], HPF(20Hz)[2B], LPF(500Hz)[2B], VREF[3B])

### Nets
NetC0_2: Cd2.2 U2.5(-VS) ; port GND
NetC1_1: U2.6(REF) ; port VREF
NetC3_1: U2.7(VOUT) ; port AMP1_OUT
NetCd1_1: Cd2.1 U2.8(+VS) ; port VCC
NetR3_1: R3.1 U2.3(RG)
NetR3_2: R3.2 U2.2(RG)
NetRb1_1: U2.4(+IN) ; port +SIGNAL
NetRb2_1: U2.1(-IN) ; port -SIGNAL

### Library data of the parts
Cd2 = CMP-2006-03056-2: as Ca1 on sheet EMGintegrated; ComponentLink2Description: Datasheet; Voltage Rating: 50 V; Digikey Description: CAP CER 0.1UF 50V 5% X7R 0603; Manufacturer Part Number: C0603C104J5RACTU; Temperature Range High: +125°C; Device Class L2: Capacitors; Octopart: https://octopart.com/c0603c104j5ractu-kemet-10440638; RoHS: TRUE; Mouser Description: Multilayer Ceramic Capacitors MLCC - SMD/SMT 50volts 0.1uF X7R 5%; Temperature Range Low: -55°C; Automotive: Yes; Lead Free: Yes; ComponentLink2URL: https://api.kemet.com/component-edge/download/datasheet/C0603C100J5GACAUTO.pdf; Material: Ceramic; Device Class L3: Ceramic Capacitors; Package: C0603C-CF; Category: Cap; Temperature: -55°C to +125°C; Height: 0.87mm; Temperature Characteristic: X7R; Device Class L1: Passive Components
R3 = CMP-1659-00032-1: Chip Resistor, 15 KOhm, +/- 1%, 0.1 W, -55 to 155 degC, 0603 (1608 Metric), RoHS, Tape and Reel; PackageDescription: 2-Pin Surface Mount Device, Body 1.6 x 0.8 mm; RoHSCompliant: true; ComponentLink2Description: Datasheet; DatasheetVersion: Rev. 4, 02/2016; ComponentLink1Description: Manufacturer URL; ComponentLink1URL: http://www.yageo.com/; PackageReference: 0603; ComponentLink2URL: http://www.yageo.com/documents/recent/PYu-RC_Group_51_RoHS_L_04.pdf
U2 = CMP-2000-05749-1: Wide Supply Range, Rail-to-Rail Output Instrumentation Amplifier, 2.2 to 36 V, -40 to 125 degC, 8-Pin SOIC (R-8), RoHS, Tube; Manufacturer: Analog Devices; PCN Design/Specification: PolyimideAlignmentTarget11/Aug/2015; Mfg Application Notes: AutomaticExternalDefibrillator(AED)SolutionsElectromagneticFlowMeterSolutionsMotorControlSolution—ServoControlProgrammableLogicControllers(PLCs)SolutionsElectrocardiogram(ECG)Solutions; EDA / CAD Models: DownloadfromAcceleratedDesigns; Design Resources: PLCandDCSUniversalAnalogInputUsingEither4or6-PinTerminalBlock; Current - Input Bias: 20nA; Product Training Modules: CommonPhotodiodeOp-AmpCircuitProblemsandSolutionsIndirectCurrentFeedbackInstrumentationAmplifierApplicationsGuide; -3db Bandwidth: 1.5MHz; Number of Circuits: 1; Current - Supply: 350µA; Current - Output / Channel: 13mA; Voltage - Input Offset: 100µV; Slew Rate: 0.6V/µs; Voltage - Supply, Single/Dual (±): 2.2V~36V,±1.35V~18V; Online Catalog: Instrumentation; Output Type: Rail-to-Rail; Mounting Type: SurfaceMount; Datasheet Version: Rev. C, 09/2012; Series: -; Category: IntegratedCircuits(ICs); Datasheet URL: http://www.analog.com/media/en/technical-documentation/data-sheets/AD8226.pdf; Mounting Technology: SurfaceMount; Standard Package: 98; Package / Case: 8-SOIC(0.154",3.90mmWidth); Package Description: 8-Pin Small Outline Package, Body 4.9 x 3.9 mm, Pitch 1.27 mm; Operating Temperature: -40°C~125°C; Gain Bandwidth Product: -; Manufacturer URL: http://www.analog.com/; Family: Linear-Amplifiers-Instrumentation,OPAmps,BufferAmps; Supplier Device Package: 8-SOIC; Package Reference: R-8; Amplifier Type: Instrumentation; Packaging: Tube

## Sheet HPF(20Hz).SchDoc
size A; SheetNumber: 5; SheetTotal: 7
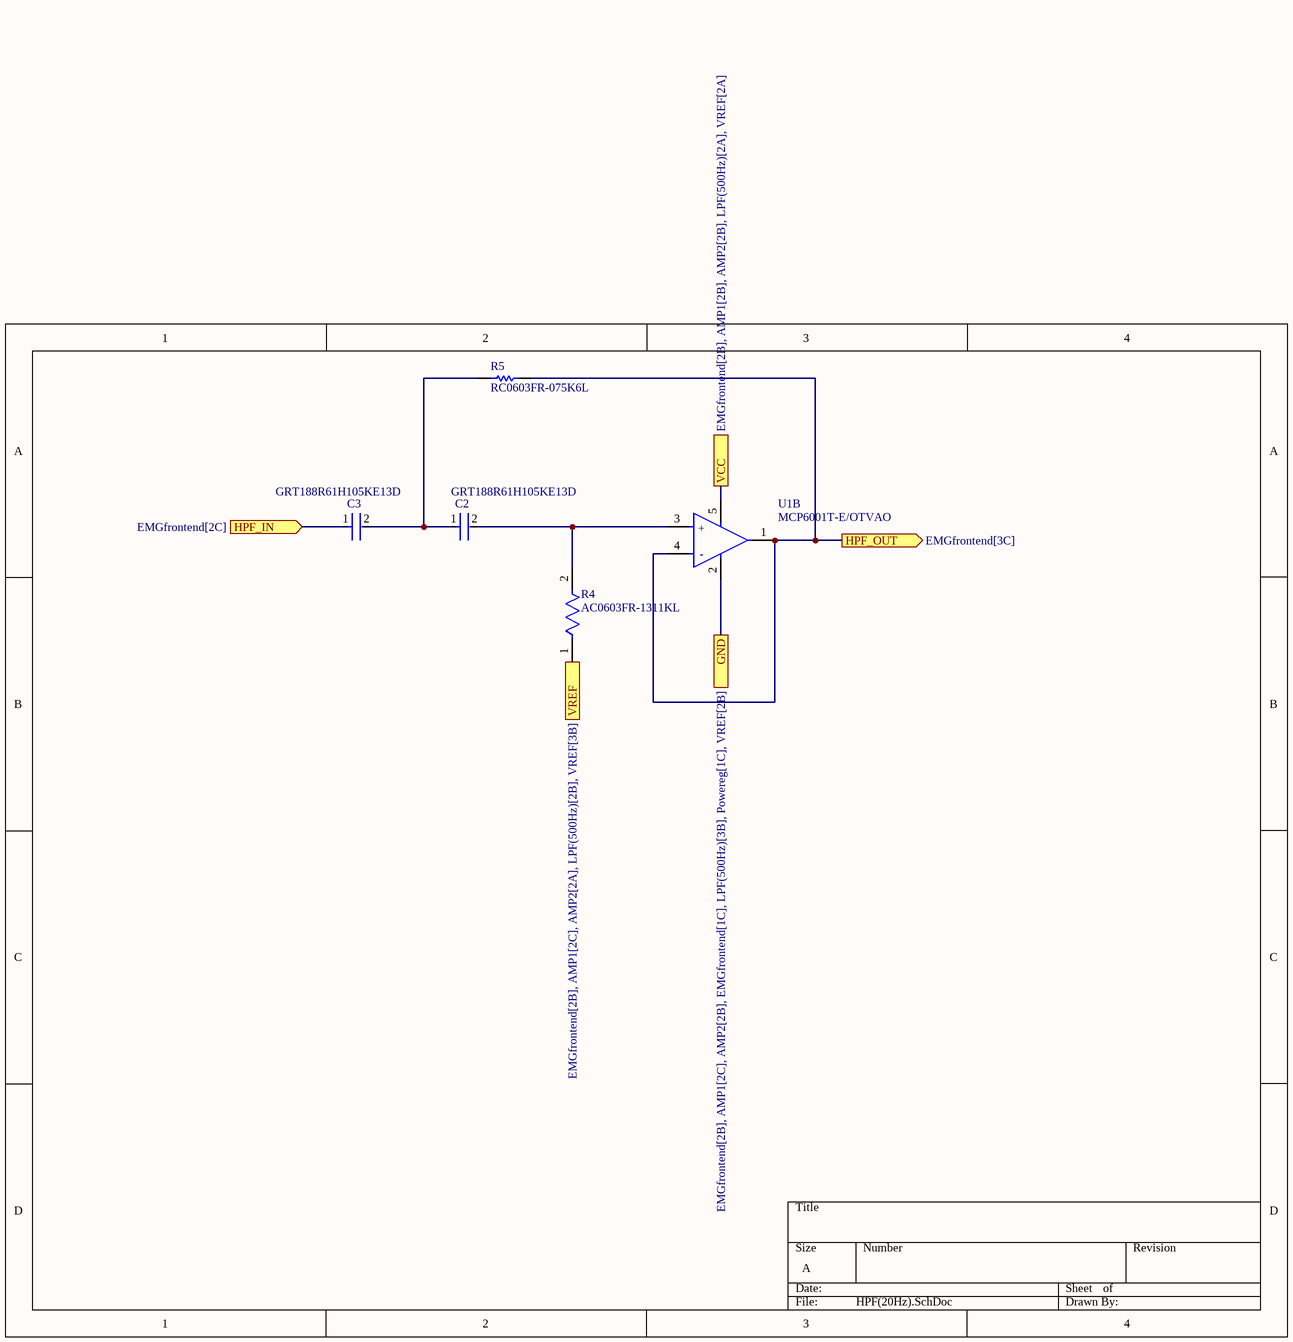
[diagram p6: HPF(20Hz).SchDoc]

### Parts
C2  GRT188R61H105KE13D  [FP-GRT188-0_1-e0_2_0_5-IPC_B]
C3  GRT188R61H105KE13D  [FP-GRT188-0_1-e0_2_0_5-IPC_B]
R4  AC0603FR-1311KL  [FP-AC0603-IPC_B]
R5  RC0603FR-075K6L  [RESC1608X55X25ML10T15]
U1B  MCP6001T-E/OTVAO  [FP-C04-091-OT-MFG]

### Ports
GND (see EMGfrontend[2B], AMP1[2C], AMP2[2B], EMGfrontend[1C], LPF(500Hz)[3B], Powereg[1C], VREF[2B]), HPF_IN (in, see EMGfrontend[2C]), HPF_OUT (out, see EMGfrontend[3C]), VCC (see EMGfrontend[2B], AMP1[2B], AMP2[2B], LPF(500Hz)[2A], VREF[2A]), VREF (in, see EMGfrontend[2B], AMP1[2C], AMP2[2A], LPF(500Hz)[2B], VREF[3B])

### Nets
NetC0_2: U1B.2(VSS) ; port GND
NetC1_1: R4.1 ; port VREF
NetC2_1: C2.1 C3.2 R5.1
NetC2_2: C2.2 R4.2 U1B.3(VIN+)
NetC3_1: C3.1 ; port HPF_IN
NetCd1_1: U1B.5(VDD) ; port VCC
NetR5_2: R5.2 U1B.1(VOUT) U1B.4(VIN-) ; port HPF_OUT

### Library data of the parts
C2 C3 = CMP-06035-031856-1: as Cv1 on sheet EMGfrontend; Voltage Rating (DC): 50V; Voltage Rating: 50V; Min Operating Temperature: -55°C; Case Code (Metric): 1608; Thickness: 0.035inch; Width: 0.031inch; Capacitance: 1uF; Tolerance: 10%; Max Operating Temperature: 85°C; Dielectric: X5R; Case Code (Imperial): 0603; Case/Package: 0603; Length: 0.063inch; Packaging: Tape and Reel; Mount: Surface Mount; Ratings: AEC-Q200
R4 = CMP-03412-047641-1: RES 11KΩ 1.00% 0.1W 0603; RoHS Compliant: Yes
R5 = CMP-1012-00595-2: Chip Resistor, 5.6 KOhm, +/- 1%, 0.1 W, -55 to 155 degC, 0603 (1608 Metric), RoHS, Tape and Reel; Voltage Rating: 50 V; Case\Package: 0603; Power Rating: 100 mW; Type (Resistor): Thick Film; Resistance: 332 kohm; ComponentLink1Description: Manufacturer URL; Case Code (Metric): 1608; Height: 0.45 mm; Min Operating Temperature: -55 degC; RoHSCompliant: true; ComponentLink2URL: http://www.yageo.com/documents/recent/PYu-RC_Group_51_RoHS_L_04.pdf; Length: 1.6 mm; ComponentLink2Description: Datasheet; Width: 0.8 mm; PackageReference: 0603; DatasheetVersion: Rev. 4, 02/2016; Package Quantity: 5000; Tolerance: 1%; Case Code (Imperial): 0603; PackageDescription: 2-Pin Surface Mount Device, Body 1.6 x 0.8 mm; ComponentLink1URL: http://www.yageo.com/; Max Operating Temperature: 155 degC; Packaging: Tape and Reel
U1B = CMP-06302-000184-2: as U1A on sheet VREF; RoHS: Non-Compliant; Height: 1.45mm; Max Operating Temperature: 125°C; Ambient Temperature Range High: 125°C; Case/Package: SOT-23-5; Min Operating Temperature: -40°C; Lifecycle Status: Production

## Sheet Powereg.SchDoc
size A; SheetNumber: 8; SheetTotal: 8
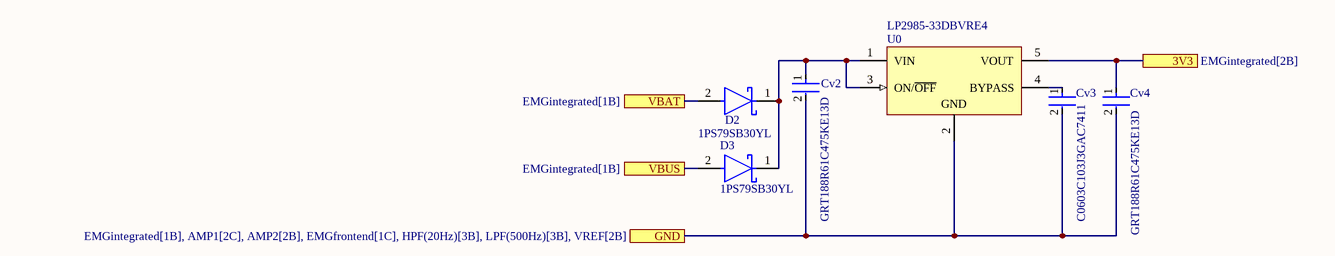
[diagram p7: Powereg.SchDoc]

### Parts
Cv2  GRT188R61C475KE13D  [FP-GRT188-0_15-IPC_C]
Cv3  C0603C103J3GAC7411  [FP-C0603C-CF-MFG]
Cv4  GRT188R61C475KE13D  [FP-GRT188-0_15-IPC_C]
D2  1PS79SB30YL  [FP-SOD523-MFG]
D3  1PS79SB30YL  [FP-SOD523-MFG]
U0  LP2985-33DBVRE4  [TI-DBV5_V]

### Ports
3V3 (see EMGintegrated[2B]), GND (see EMGintegrated[1B], AMP1[2C], AMP2[2B], EMGfrontend[1C], HPF(20Hz)[3B], LPF(500Hz)[3B], VREF[2B]), VBAT (see EMGintegrated[1B]), VBUS (see EMGintegrated[1B])

### Nets
NetC0_2: Cv2.2 Cv3.2 Cv4.2 U0.2(GND) ; port GND
NetCd4_2: Cv4.1 U0.5(VOUT) ; port 3V3
NetCv2_1: Cv2.1 D2.1(C) D3.1(C) U0.1(VIN) U0.3(ON/~{OFF})
NetCv3_1: Cv3.1 U0.4(BYPASS)
NetD2_2: D2.2(A) ; port VBAT
NetD3_2: D3.2(A) ; port VBUS

### Library data of the parts
Cv2 Cv4 = CMP-06035-009119-1: as Cd7 on sheet EMGintegrated; Mount: Surface Mount; Width: 0.031inch; Case Code (Imperial): 0603; Capacitance: 4.7uF; Thickness: 0.035inch; Packaging: Cut Tape; Min Operating Temperature: -55°C; Case Code (Metric): 1608; Case/Package: 0603; Tolerance: 10%; Length: 0.063inch; Ratings: AEC-Q200; Max Operating Temperature: 85°C; Voltage Rating: 16V
Cv3 = CMP-03020-031050-2: C0603 10,000 pF C0G 30ppm/°C 5.00% 25 V; Manufacturer: KEMET; Tolerance: 0.05; Automotive Grade: Grade 1; Voltage Rating: 25 V; Device Class L3: Ceramic Capacitors; ComponentLink2URL: https://api.kemet.com/component-edge/download/datasheet/C0603C100J5GACAUTO.pdf; Capacitance: 10,000 pF; RoHS: TRUE; Manufacturer Part Number: C0603C103J3GAC7411; Temperature Coefficient: 30ppm/°C; Lead Free: Yes; Height: 0.87mm; Temperature Range Low: -55°C; Value: 10,000 pF; Temperature Range High: +125°C; ComponentLink2Description: Datasheet; Material: Ceramic; Package: C0603C-CF; Temperature Characteristic: C0G; Temperature: -55°C to +125°C; Category: Cap; Octopart: https://octopart.com/c0603c103j3gac7411-kemet-91893810; Device Class L2: Capacitors; Device Class L1: Passive Components; Automotive: Yes
D2 D3 = CMP-14398-000044-1: as D7 on sheet EMGintegrated
U0 = CMP-0758-00029-1: Single Output Low Noise LDO, 150 mA, Fixed 3.3 V Output, 1.5% Tolerance, 2.2 to 16 V Input, Low IQ, 5-Pin SOT-23 (DBV), -40 to 125 degC, Green (RoHS & no Sb/Br), Tape and Reel; Manufacturer: Texas Instruments; Iout (Max) (A): 0.15; Output Options: Fixed Output; Fixed Output Options (V): 3.3; Vdo (Typ) (mV): 280; Accuracy (%): 1.5; Iq (Typ) (mA): 0.85; DatasheetVersion: SLVS522N; ComponentLink3URL: http://www.ti.com/litv/pdf/mpds018j; PackageDescription: 5-Pin Plastic Small Outline, Body 2.9 x 1.6 mm, Pitch 0.95 mm; PackageReference: DBV5; ComponentLink2URL: http://www.ti.com/lit/ds/symlink/lp2985-50.pdf; ComponentLink3Description: Package Specification; ComponentLink1URL: http://www.ti.com/; Operating Temperature Range (degC): -40 to 125; Mounting Technology: Surface Mount; PackageVersion: 4073253-4/L; ComponentLink2Description: Datasheet; ComponentLink1Description: Manufacturer URL; Packing: Tape and Reel; PartNumber: LP2985-33DBVRE4; Vin (V): 2.2 to 16; RoHS: TRUE

## Nets that join several sheets
NetC0_1: EMGintegrated (MCU1.9 MCU1.10 MCU1.11 MCU1.12), EMGfrontend (C0.1 R0.2)
NetC0_2: EMGintegrated (35 pins), EMGfrontend (C0.2 Cv1.1), VREF (C1.2 Cd1.2 R1.1 U1A.2), AMP2 (U3.4), LPF(500Hz) (Cd3.2 U3.4), AMP1 (Cd2.2 U2.5), HPF(20Hz) (U1B.2), Powereg (Cv2.2 Cv3.2 Cv4.2 U0.2)
NetC1_1: EMGintegrated (J1.2), EMGfrontend (Rb1.2 Rb2.2), VREF (C1.1 R12.2), AMP2 (R8.1), LPF(500Hz) (C5.2), AMP1 (U2.6), HPF(20Hz) (R4.1)
NetC3_1: AMP1 (U2.7), HPF(20Hz) (C3.1)
NetC4_2: EMGfrontend (R0.1), LPF(500Hz) (C4.2 U3.6 U3.7)
NetCd1_1: EMGfrontend (Cv1.2 L1.2), VREF (Cd1.1 R2.2 U1A.5), AMP2 (U3.8), LPF(500Hz) (Cd3.1 U3.8), AMP1 (Cd2.1 U2.8), HPF(20Hz) (U1B.5)
NetCd4_2: EMGintegrated (8 pins), EMGfrontend (L1.1), Powereg (Cv4.1 U0.5)
NetD2_2: EMGintegrated (J2.2 Ra1.1), Powereg (D2.2)
NetD3_2: EMGintegrated (5 pins), Powereg (D3.2)
NetJ1_1: EMGintegrated (J1.1), EMGfrontend (Ri1.1)
NetJ1_3: EMGintegrated (J1.3), EMGfrontend (Ri2.1)
NetR5_2: AMP2 (R6.1), HPF(20Hz) (R5.2 U1B.1 U1B.4)
NetR7_2: AMP2 (R7.2 U3.1), LPF(500Hz) (R9.1)
NetRb1_1: EMGfrontend (Rb1.1 Ri1.2), AMP1 (U2.4)
NetRb2_1: EMGfrontend (Rb2.1 Ri2.2), AMP1 (U2.1)